# EasyEDA Pro project 低功耗MCU温度测量.epro

# Schematic Schematic1_1
Assembly Variant: Basic; Board Name: Board1; Create Date: 2026-09-13; Page Name: P1; Project Name: 低功耗MCU温度测量; Schematic Name: Schematic1; Update Date: 2026-09-13; Company: 嘉立创EDA; Page Size: A4; Version: V1.0
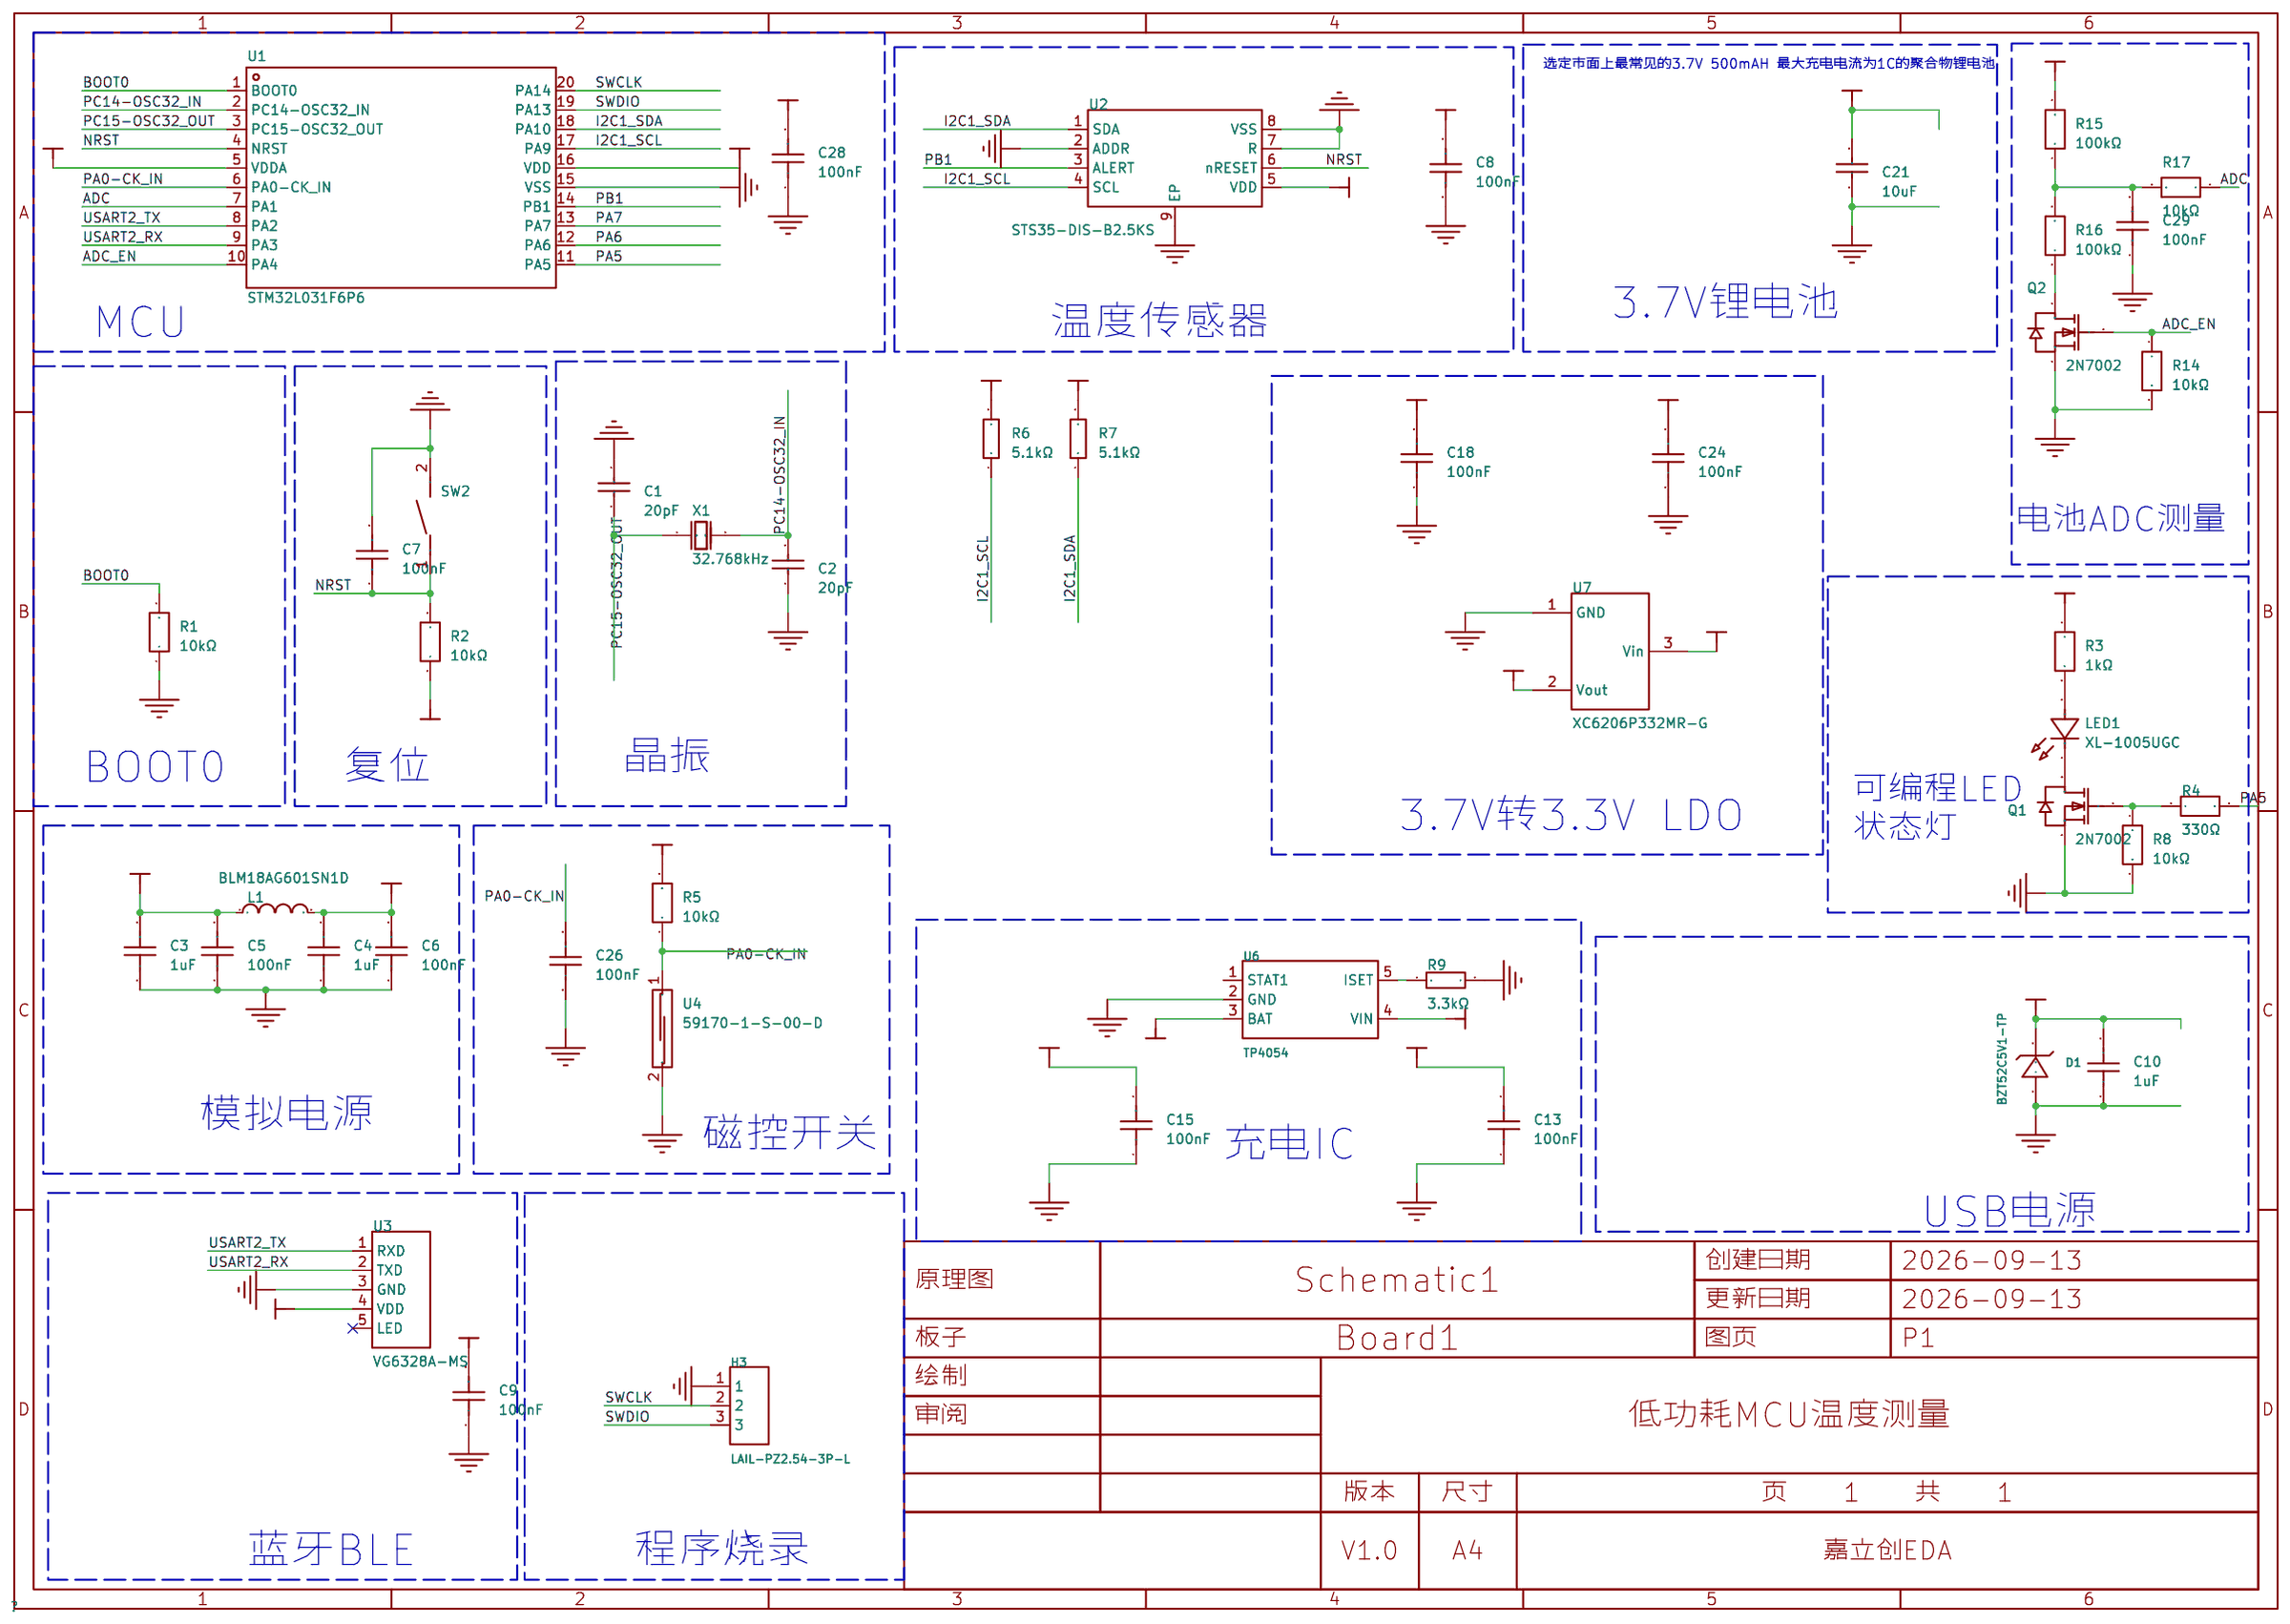
[diagram p0: schematic sheet]

## Parts
C1  20pF  [C0402]
C2  20pF  [C0402]
C3  1uF  [C0402]
C4  1uF  [C0402]
C5  100nF  [C0402]
C6  100nF  [C0402]
C7  100nF  [C0402]
C8  100nF  [C0402]
C9  100nF  [C0402]
C10  1uF  [C0402]
C13  100nF  [C0402]
C15  100nF  [C0402]
C18  100nF  [C0402]
C21  10uF  [C0402]
C24  100nF  [C0402]
C26  100nF  [C0402]
C28  100nF  [C0402]
C29  100nF  [C0402]
D1  BZT52C5V1-TP  [SOD-123_L2.8-W1.6-LS3.7-RD_1]
H3  LAIL-PZ2.54-3P-L  [HDR-TH_3P-P2.54-V-M-1]
L1  BLM18AG601SN1D  [L0603]
LED1  XL-1005UGC  [LED0402-RD_GREEN]
Q1  2N7002  [SOT-23-3_L2.9-W1.3-P1.90-LS2.4-BR]
Q2  2N7002  [SOT-23-3_L2.9-W1.3-P1.90-LS2.4-BR]
R1  10kΩ  [R0402]
R2  10kΩ  [R0402]
R3  1kΩ  [R0402]
R4  330Ω  [R0402]
R5  10kΩ  [R0402]
R6  5.1kΩ  [R0402]
R7  5.1kΩ  [R0402]
R8  10kΩ  [R0402]
R9  3.3kΩ  [R0402]
R14  10kΩ  [R0402]
R15  100kΩ  [R0402]
R16  100kΩ  [R0402]
R17  10kΩ  [R0402]
SW2  TS-1088-AR02016  [SW-SMD_L3.9-W3.0-P4.45]
U1  STM32L031F6P6  [TSSOP-20_L6.5-W4.4-P0.65-LS6.4-BL]
U2  STS35-DIS-B2.5KS  [DFN-8_L2.5-W2.5-P0.50-TL-EP]
U3  VG6328A-MS  [COMM-SMD_5P-L16.0-W13.6-P2.54_I6328A]
U4  59170-1-S-00-D  [SENSOR-SMD_59170-1-S-00-D]
U6  TP4054  [SOT-23-5_L2.9-W1.6-P0.95-LS2.8-BL]
U7  XC6206P332MR-G  [SOT-23-3_L2.9-W1.6-P1.90-LS2.8-BR]
X1  32.768kHz  [CRYSTAL-SMD_2P-L2.0-W1.2]

## Library data of the parts
C1 C2 = CC0402JRNPO9BN200: 容值:20pF;精度:±5%;额定电压:50V;温度系数:NP0;; LCSC Part Name: 20pF ±5% 50V; Supplier Part: C107000; Manufacturer: YAGEO(国巨); Supplier Footprint: 0402; JLCPCB Part Class: Extended Part; Datasheet: https://item.szlcsc.com/datasheet/CC0402JRNPO9BN200/108216.html; Supplier: LCSC; Tolerance: ±5%; Voltage Rating: 50V; Temperature Coefficient: NP0
C3 C4 C10 = HGC0402R5105K500NTEJ: 容值:1uF;精度:±10%;额定电压:50V;温度系数:X5R;; LCSC Part Name: 1uF ±10% 50V; Supplier Part: C7472948; Manufacturer: Chinocera(华瓷); Supplier Footprint: 0402; JLCPCB Part Class: Extended Part; Datasheet: https://item.szlcsc.com/datasheet/HGC0402R5105K500NTEJ/8532795.html; Supplier: LCSC; Tolerance: ±10%; Voltage Rating: 50V; Temperature Coefficient: X5R
C5-C9 C13 C15 C18 C24 C26 C28 C29 = CL05B104KO5NNNC: 容值:100nF;精度:±10%;额定电压:16V;温度系数:X7R;; LCSC Part Name: 100nF ±10% 16V; Supplier Part: C1525; Manufacturer: SAMSUNG(三星); Supplier Footprint: 0402; JLCPCB Part Class: Basic Part; Datasheet: https://item.szlcsc.com/datasheet/CL05B104KO5NNNC/1877.html; Supplier: LCSC; Tolerance: ±10%; Voltage Rating: 16V; Temperature Coefficient: X7R
C21 = CL05A106MQ5NUNC: 容值:10uF;精度:±20%;额定电压:6.3V;温度系数:X5R;; LCSC Part Name: 10uF ±20% 6.3V; Supplier Part: C15525; Manufacturer: SAMSUNG(三星); Supplier Footprint: 0402; JLCPCB Part Class: Basic Part; Datasheet: https://item.szlcsc.com/datasheet/CL05A106MQ5NUNC/16204.html; Supplier: LCSC; Tolerance: ±20%; Voltage Rating: 6.3V; Temperature Coefficient: X5R
D1 = BZT52C5V1-TP: 二极管配置:1个独立式;稳压值(标称值):5.1V;稳压值(范围):4.8V~5.4V;耗散功率(Pd):500mW;; LCSC Part Name: 独立式 耐压:5.1V 电流:2uA@2V; Supplier Part: C78728; Manufacturer: MCC(美微科); Supplier Footprint: SOD-123; JLCPCB Part Class: Extended Part; Datasheet: https://item.szlcsc.com/datasheet/BZT52C5V1-TP/79865.html; Supplier: LCSC; Diode Configuration: 1个独立式; Zener Voltage(Nom): 5.1V; Reverse Leakage Current (Ir): 2uA@2V; Zener Voltage(Range): 4.8V~5.4V; Pd - Power Dissipation: 500mW; Impedance(Zzt): 60Ω; Impedance(Zzk): 480Ω; Operating Junction Temperature Range: -65℃~+150℃
H3 = LAIL-PZ2.54-3P-L: 插针结构:1x3P;间距:2.54mm;圆针/方针:方针;排数:单排;总PIN位数:3P;额定电流:3A;额定电压:250V;塑高:2.5mm;端接针长度:3mm;触头材质:黄铜;触头镀层:金;工作温度:-25℃~+80℃;颜色:黑色;; LCSC Part Name: 1x3P 间距:2.54mm 方针; Supplier Part: C54950604; Manufacturer: LAILAN(莱联); Supplier Footprint: 插件,P=2.54mm; JLCPCB Part Class: Extended Part; Datasheet: https://item.szlcsc.com/datasheet/LAIL-PZ2.54-3P-L/58519957.html; Supplier: LCSC; Pin Structure: 1x3P; Pitch: 2.54mm; Circluar Pins/Square Pins: 方针; Number of Rows: 单排; Number of Pins: 3P; Current Rating: 3A; Voltage Rating (Max): 250V; Insulation Height: 2.5mm; Length of End Connection Pin: 3mm; Contact Material: 黄铜; Contact Plating: 金; Operating Temperature: -25℃~+80℃; Color: 黑色
L1 = BLM18AG601SN1D: 阻抗@频率:600Ω@100MHz;误差:±25%;直流电阻(DCR):380mΩ;; LCSC Part Name: 单路 0603磁珠 阻抗600Ω@100MHz; Supplier Part: C19330; Manufacturer: muRata(村田); Supplier Footprint: 0603; JLCPCB Part Class: Extended Part; Datasheet: https://item.szlcsc.com/datasheet/BLM18AG601SN1D/20038.html; Supplier: LCSC; Impedance @ Frequency: 600Ω@100MHz; Tolerance: ±25%; DC Resistance(DCR): 380mΩ; Current Rating: 500mA; Number of Circuits: 1; Operating Temperature: -55℃~+125℃
LED1 = XL-1005UGC_C965793: 灯头类型:1mmx0.5mm方形灯头;发光颜色:翠绿色;正向压降(Vf):3V;功率:80mW;测试电流:25mA;波长:516nm~531nm;二极管配置:独立二极管;透镜颜色:无色透明透镜;色温:-;发光强度:249mcd;发光角度:120°;载带方式:正贴;工作温度:-40℃~+85℃;; LCSC Part Name: 0402翠绿贴片式发光二极管; Supplier Part: C965793; Manufacturer: XINGLIGHT(成兴光); Supplier Footprint: 0402; JLCPCB Part Class: Extended Part; Datasheet: https://item.szlcsc.com/datasheet/XL-1005UGC/1051402.html; Supplier: LCSC; Lamp Holder Type: 1mmx0.5mm方形灯头; Illumination Color: 翠绿色; Voltage - Forward(Vf): 3V; Power(Watts): 80mW; Test Current: 25mA; Wavelength - Dominant: 516nm~531nm; Peak Wavelength: 531nm; Diode Configuration: 独立二极管; Lens Color: 无色透明透镜; Luminous Intensity: 249mcd; Viewing Angle: 120°; Mounting Style: 正贴; Operating Temperature: -40℃~+85℃
Q1 Q2 = 2N7002_C8545: 数量:1个N沟道;漏源电压(Vdss):60V;连续漏极电流(Id):115mA;导通电阻(RDS(on)):5Ω@10V;耗散功率(Pd):225mW;阈值电压(Vgs(th)):2.5V;; LCSC Part Name: 1个N沟道 耐压:60V 电流:115mA; Supplier Part: C8545; Manufacturer: CJ(江苏长电/长晶); Supplier Footprint: SOT-23; JLCPCB Part Class: Basic Part; Datasheet: https://item.szlcsc.com/datasheet/2N7002/9040.html; Supplier: LCSC; Number: 1个N沟道; Drain to Source Voltage: 60V; Current - Continuous Drain(Id): 115mA; RDS(on): 5Ω@10V; Pd - Power Dissipation: 225mW; Gate Threshold Voltage (Vgs(th)): 2.5V; Input Capacitance(Ciss): 50pF; Reverse Transfer Capacitance (Crss@Vds): 5pF; Type: N沟道; Output Capacitance(Coss): 25pF; Vgs: ±20V
R1 R2 R5 R8 R14 R17 = FRC0402F1002TS: 电阻类型:厚膜电阻;阻值:10kΩ;精度:±1%;功率:62.5mW;工作电压:50V;温度系数:±100ppm/℃;; LCSC Part Name: 10kΩ ±1% 62.5mW 厚膜电阻; Supplier Part: C2906861; Manufacturer: FOJAN(富捷); Supplier Footprint: 0402; JLCPCB Part Class: Extended Part; Datasheet: https://item.szlcsc.com/datasheet/FRC0402F1002TS/3180374.html; Supplier: LCSC; Type: 厚膜电阻; Tolerance: ±1%; Power(Watts): 62.5mW; Voltage-Supply(Max): 50V; Temperature Coefficient: ±100ppm/℃; Operating Temperature: -55℃~+155℃
R3 = FRC0402F1001TS: 电阻类型:厚膜电阻;阻值:1kΩ;精度:±1%;功率:62.5mW;工作电压:50V;温度系数:±100ppm/℃;; LCSC Part Name: 1kΩ ±1% 62.5mW 厚膜电阻; Supplier Part: C2906864; Manufacturer: FOJAN(富捷); Supplier Footprint: 0402; JLCPCB Part Class: Extended Part; Datasheet: https://item.szlcsc.com/datasheet/FRC0402F1001TS/3180377.html; Supplier: LCSC; Type: 厚膜电阻; Tolerance: ±1%; Power(Watts): 62.5mW; Voltage-Supply(Max): 50V; Temperature Coefficient: ±100ppm/℃; Operating Temperature: -55℃~+155℃
R4 = FRC0402J331 TS: 电阻类型:厚膜电阻;阻值:330Ω;精度:±5%;功率:62.5mW;工作电压:50V;温度系数:±100ppm/℃;; LCSC Part Name: 330Ω ±5% 62.5mW 厚膜电阻; Supplier Part: C2906929; Manufacturer: FOJAN(富捷); Supplier Footprint: 0402; JLCPCB Part Class: Extended Part; Datasheet: https://item.szlcsc.com/datasheet/FRC0402J331%2520TS/3180442.html; Supplier: LCSC; Type: 厚膜电阻; Tolerance: ±5%; Power(Watts): 62.5mW; Voltage-Supply(Max): 50V; Temperature Coefficient: ±100ppm/℃; Operating Temperature: -55℃~+155℃
R6 R7 = 0402WGF5101TCE: 电阻类型:厚膜电阻;阻值:5.1kΩ;精度:±1%;功率:62.5mW;工作电压:50V;温度系数:±100ppm/℃;; LCSC Part Name: 厚膜电阻 5.1kΩ ±1%; Supplier Part: C25905; Manufacturer: UNI-ROYAL(厚声); Supplier Footprint: 0402; JLCPCB Part Class: Basic Part; Datasheet: https://item.szlcsc.com/datasheet/0402WGF5101TCE/26648.html; Supplier: LCSC; Type: 厚膜电阻; Tolerance: ±1%; Power(Watts): 62.5mW; Voltage-Supply(Max): 50V; Temperature Coefficient: ±100ppm/℃; Operating Temperature: -55℃~+155℃
R9 = 0402WGF3301TCE: 电阻类型:厚膜电阻;阻值:3.3kΩ;精度:±1%;功率:62.5mW;工作电压:50V;温度系数:±100ppm/℃;; LCSC Part Name: 厚膜电阻 3.3kΩ ±1%; Supplier Part: C25890; Manufacturer: UNI-ROYAL(厚声); Supplier Footprint: 0402; JLCPCB Part Class: Basic Part; Datasheet: https://item.szlcsc.com/datasheet/0402WGF3301TCE/26633.html; Supplier: LCSC; Type: 厚膜电阻; Tolerance: ±1%; Power(Watts): 62.5mW; Voltage-Supply(Max): 50V; Temperature Coefficient: ±100ppm/℃; Operating Temperature: -55℃~+155℃
R15 R16 = RCA02100KJLF: 电阻类型:厚膜电阻;阻值:100kΩ;精度:±5%;功率:62.5mW;工作电压:50V;温度系数:±200ppm/℃;; LCSC Part Name: 100kΩ ±5% 62.5mW; Supplier Part: C22369186; Manufacturer: HKR(香港电阻); Supplier Footprint: 0402; JLCPCB Part Class: Extended Part; Datasheet: https://item.szlcsc.com/datasheet/RCA02100KJLF/23848216.html; Supplier: LCSC; Type: 厚膜电阻; Tolerance: ±5%; Power(Watts): 62.5mW; Voltage-Supply(Max): 50V; Temperature Coefficient: ±200ppm/℃; Operating Temperature: -55℃~+155℃
SW2 = TS-1088-AR02016: 电路结构:单刀单掷;按钮形状:圆形按钮;作用力:1.6N;安装方式:立贴;开关长度:3.9mm;开关宽度:3mm;开关高度:2mm;带支架:不带支架;触点电流:50mA;额定电压:12V;带灯:-;工作寿命:10万次;; LCSC Part Name: 3.9*3*2mm 立贴 轻触开关; Supplier Part: C720477; Manufacturer: XUNPU(讯普); Supplier Footprint: SMD,4x3mm; JLCPCB Part Class: Basic Part; Datasheet: https://item.szlcsc.com/datasheet/TS-1088-AR02016/763484.html; Supplier: LCSC; Circuit: 单刀单掷; Actuator Style: 圆形按钮; Operating Force: 1.6N; Mounting Type: 立贴; Length: 3.9mm; Width: 3mm; Switch Height: 2mm; with Bracket: 不带支架; Contact Current: 50mA; Voltage Rating: 12V; Actuator/Cap Color: 黑色; Termination Style: SMD接片; Life: 10万次; Operating Temperature: -30℃~+80℃
U1 = STM32L031F6P6: CPU内核:ARM Cortex-M0+;CPU最大主频:32MHz;CPU位数:32 Bit;; LCSC Part Name: 超低功耗Arm Cortex-M0+ MCU，具有32-KB Flash存储器和32 MHz CPU; Supplier Part: C115208; Manufacturer: ST(意法半导体); Supplier Footprint: TSSOP-20; JLCPCB Part Class: Extended Part; Datasheet: https://item.szlcsc.com/datasheet/STM32L031F6P6/116454.html; Supplier: LCSC; CPU Core: ARM Cortex-M0+; CPU Maximum Speed: 32MHz; Core Size: 32 Bit; Program Storage Size: 32KB; Program Memory Type: FLASH; RAM Size: 8KB; EEPROM: 1KB; Number of I/O: 15; ADC (Bit): 12bit; Oscillator Type: 内置; Voltage - Supply: 1.8V~3.6V; Operating Temperature: -40℃~+85℃
U2 = STS35-DIS-B2.5KS_C7461886: 检测温度:-;精度:±0.1℃;接口类型:I2C;; LCSC Part Name: 高精度数字温度传感器IC，采用CMOSens技术，具备完全校准和线性化数字输出、I2C接口，适用于多种应用; Supplier Part: C7461886; Manufacturer: Sensirion(瑞士盛思锐); Supplier Footprint: DFN-8(2.5x2.5); JLCPCB Part Class: Extended Part; Datasheet: https://item.szlcsc.com/datasheet/STS35-DIS-B2.5KS/8492078.html; Supplier: LCSC; Tolerance: ±0.1℃; Voltage - Supply: 2.15V~5.5V; Standby Current: 2uA; Interface: I2C; Temperature Conversion Time: 12.5ms; Features: 温度阈值监测；出厂温度校准；片内非易失参数存储；低功耗待机
U3 = VG6328A-MS: 核心芯片:-;接口类型:UART;发射功率:1dBm;通讯距离:20m；60m;接收灵敏度:-92dBm;; LCSC Part Name: AC6328A低功耗主从一体串口透传蓝牙模块; Supplier Part: C48818398; Manufacturer: Vollgo(沃进); Supplier Footprint: SMD,16x13.6mm; JLCPCB Part Class: Extended Part; Datasheet: https://item.szlcsc.com/datasheet/VG6328A-MS/51117022.html; Supplier: LCSC; Interface Type: UART; Wireless Standard: 蓝牙5.3; Output Power(Max): 1dBm; Voltage - Supply: 1.8V~3.6V; Communication Distance: 20m；60m; Sensitivity: -92dBm; Operating Temperature: -40℃~+85℃
U4 = 59170-1-S-00-D: 59170是一款超小型模塑干簧开关，尺寸为11.43mm x 2.29mm x 2.29mm（0.450英寸 x 0.090英寸 x 0.090英寸），引脚有直脚和鸥翼脚两种类型。该开关为常开触点，能够在10W功率下切换高达200Vdc的电压。; LCSC Part Name: 超小型复模簧片开关; Supplier Part: C315909; Manufacturer: Littelfuse(美国力特); Supplier Footprint: SMD; JLCPCB Part Class: Extended Part; Datasheet: https://item.szlcsc.com/datasheet/59170-1-S-00-D/297544.html; Supplier: LCSC
U6 = TP4054_C55349166: 工作电压:-300mV~7.5V;最大充电电流:600mA;电池类型:锂电池;电池节数:1;; Supplier Part: C55349166; Manufacturer: R+O(宏嘉诚); Supplier Footprint: SOT-23-5L; JLCPCB Part Class: Extended Part; Datasheet: https://item.szlcsc.com/datasheet/TP4054/59290393.html; Supplier: LCSC; The Chip Type: 保护芯片; Voltage - Supply: -300mV~7.5V; Charge Current - Max: 600mA; Charging Saturation Voltage: 4.2V; End-Off Voltage: 3V; Type of Battery: 锂电池; Number of Cells: 1; Operating Temperature: -40℃~+85℃
U7 = XC6206P332MR-G_C5446: 输出极性:正极;工作电压:6V;输出电压:3.3V;输出电流:200mA;电源纹波抑制比(PSRR):-;输出类型:固定;; LCSC Part Name: 3.3V 200mA 6V; Supplier Part: C5446; Manufacturer: TOREX(特瑞仕); Supplier Footprint: SOT-23-3L; JLCPCB Part Class: Basic Part; Datasheet: https://item.szlcsc.com/datasheet/XC6206P332MR-G/5896.html; Supplier: LCSC; Output Configuration: 正极; Voltage - Supply: 6V; Output Voltage: 3.3V; Output Current: 200mA; standby current: 1uA; Features: 短路保护；过流保护; Operating Temperature: -40℃~+85℃@(Ta); Output Type: 固定; Number of Outputs: 1
X1 = XKHEL89CGI-112YLC-32.768K: 晶振类型:贴片晶振;频率:32.768kHz;常温频差:±20ppm;负载电容:12.5pF;频率稳定度:-;; LCSC Part Name: YSX2012SK 32.768KHZ 2P 2012 12.5PF ±20PPM -40~85℃; Supplier Part: C7500573; Manufacturer: YXC(扬兴晶振); Supplier Footprint: SMD2012-2P; JLCPCB Part Class: Extended Part; Datasheet: https://item.szlcsc.com/datasheet/XKHEL89CGI-112YLC-32.768K/8579117.html; Supplier: LCSC; Type: 贴片晶振; Normal temperature Frequency Tolerance: ±20ppm; Load Capacitance: 12.5pF; Equivalent Series Resistance(ESR): 100kΩ; Operating Temperature: -40℃~+85℃

## Nets
3.3V: C3.2 C5.2 C8.1 C9.2 C24.2 C28.2 L1.1 R2.1 R3.1 R5.2 R6.2 R7.2 U1.16(VDD) U2.5(VDD) U3.4(VDD) U7.2(Vout)
3.7V: C15.2 C18.2 C21.2 R15.2 U6.3(BAT) U7.3(Vin)
+5V: C10.2 C13.2 D1.1(K) U6.4(VIN)
A3.3V: C4.2 C6.2 L1.2 U1.5(VDDA)
GND: C1.2 C2.1 C3.1 C4.1 C5.1 C6.1 C7.2 C8.2 C9.1 C10.1 C13.1 C15.1 C18.1 C21.1 C24.1 C26.1 C28.1 C29.1 D1.2(A) H3.1 Q1.2(S) Q2.2(S) R1.1 R8.2 R9.1 R14.2 SW2.2 U1.15(VSS) U2.2(ADDR) U2.7(R) U2.8(VSS) U2.9(EP) U3.3(GND) U4.2 U6.2(GND) U7.1(GND)
ADC: R17.1 U1.7(PA1)
ADC_EN: Q2.1(G) R14.1 U1.10(PA4)
BOOT0: R1.2 U1.1(BOOT0)
I2C1_SCL: R6.1 U1.17(PA9) U2.4(SCL)
I2C1_SDA: R7.1 U1.18(PA10) U2.1(SDA)
NRST: C7.1 R2.2 SW2.1 U1.4(NRST) U2.6(nRESET)
PA0-CK_IN: C26.2 R5.1 U1.6(PA0-CK_IN) U4.1
PA5: R4.2 U1.11(PA5)
PA6: U1.12(PA6)
PA7: U1.13(PA7)
PB1: U1.14(PB1) U2.3(ALERT)
PC14-OSC32_IN: C2.2 U1.2(PC14-OSC32_IN) X1.2(OSC2)
PC15-OSC32_OUT: C1.1 U1.3(PC15-OSC32_OUT) X1.1(OSC1)
SWCLK: H3.2 U1.20(PA14)
SWDIO: H3.3 U1.19(PA13)
USART2_RX: U1.9(PA3) U3.2(TXD)
USART2_TX: U1.8(PA2) U3.1(RXD)
$C29_2: C29.2 R15.1 R16.2 R17.2
$LED1_1: LED1.1(K) Q1.3(D)
$LED1_2: LED1.2(A) R3.2
$Q1_1: Q1.1(G) R4.1 R8.1
$Q2_3: Q2.3(D) R16.1
$R9_2: R9.2 U6.5(ISET)

Not connected (* = marked no-connect by the designer): U3 5(LED)*; U6 1(STAT1)

## Notes on the sheet
- 选定市面上最常见的3.7V 500mAH 最大充电电流为1C的聚合物锂电池
- MCU
- 温度传感器
- 3.7V锂电池
- 电池ADC测量
- 晶振
- 可编程LED
  状态灯
- BOOT0
- 复位
- 3.7V转3.3V LDO
- 模拟电源
- 磁控开关
- 充电IC
- USB电源
- 蓝牙BLE
- 程序烧录

# Board PCB
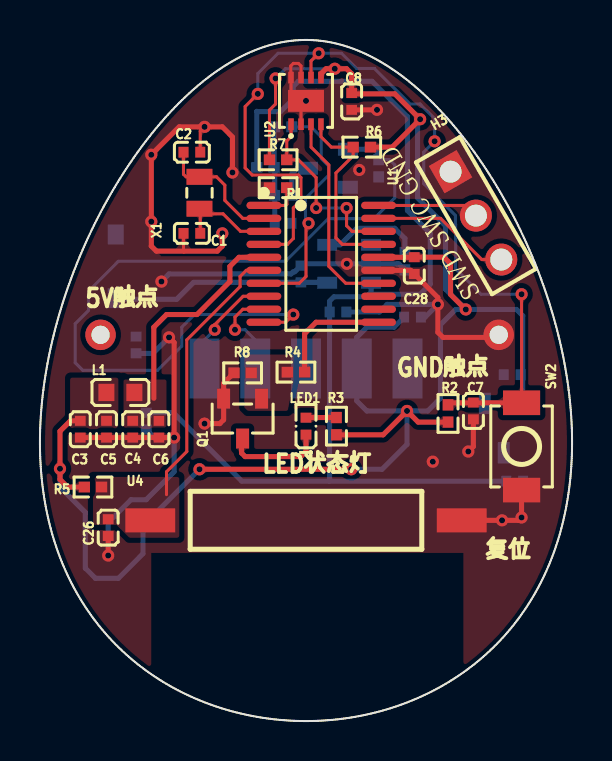
[diagram p1: board, top side]
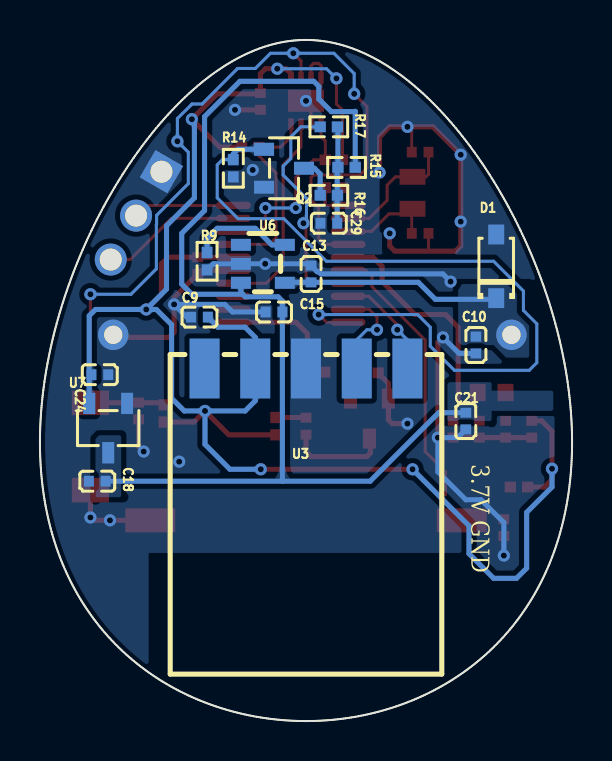
[diagram p2: board, bottom side, seen from below]

Outline 26.65 x 34.1 mm; copper layers: Top Layer, Bottom Layer. Coordinates in mm from the lower left corner of the outline.
Outline path: 0,14.06 0,13.86 0,13.75 0,13.55 0.01,13.45 0.01,13.35 0.01,13.25 0.02,13.15 0.03,12.94 0.03,12.84 0.04,12.74 0.05,12.64 0.05,12.54 0.06,12.44 0.07,12.34 0.08,12.24 0.09,12.14 0.1,12.04 0.11,11.94 0.12,11.84 0.13,11.74 0.15,11.64 0.16,11.54 0.17,11.44 0.19,11.34 0.2,11.24 0.24,11.04 0.25,10.94 0.29,10.75 0.31,10.65 0.33,10.55 0.35,10.45 0.37,10.35 0.39,10.25 0.41,10.16 0.43,10.06 0.46,9.96 0.48,9.87 0.5,9.77 0.53,9.67 0.58,9.48 0.61,9.38 0.67,9.19 0.69,9.1 0.72,9 0.75,8.91 0.78,8.81 0.82,8.72 0.85,8.62 0.88,8.53 0.92,8.44 0.95,8.34 0.98,8.25 1.02,8.16 1.06,8.07 1.09,7.97 1.13,7.88 1.17,7.79 1.21,7.7 1.25,7.61 1.29,7.52 1.33,7.43 1.37,7.34 1.41,7.25 1.45,7.16 1.5,7.07 1.54,6.98 1.59,6.89 1.63,6.81 1.68,6.72 1.72,6.63 1.77,6.55 1.82,6.46 1.87,6.37 1.92,6.29 1.97,6.2 2.02,6.12 2.07,6.03 2.12,5.95 2.17,5.87 2.23,5.79 2.28,5.7 2.34,5.62 2.39,5.54 2.45,5.46 2.5,5.38 2.56,5.3 2.62,5.22 2.68,5.14 2.74,5.06 2.79,4.98 2.85,4.9 2.92,4.83 2.98,4.75 3.04,4.67 3.1,4.6 3.23,4.45 3.29,4.37 3.36,4.3 3.42,4.23 3.49,4.15 3.56,4.08 3.62,4.01 3.69,3.94 3.76,3.87 3.83,3.8 3.9,3.73 3.97,3.66 4.04,3.59 4.11,3.53 4.18,3.46 4.25,3.39 4.33,3.33 4.4,3.26 4.48,3.2 4.55,3.13 4.62,3.07 4.7,3.01 4.78,2.94 4.85,2.88 4.93,2.82 5.01,2.76 5.09,2.7 5.16,2.64 5.24,2.58 5.32,2.52 5.4,2.47 5.48,2.41 5.56,2.35 5.65,2.3 5.73,2.24 5.81,2.19 5.89,2.13 5.97,2.08 6.06,2.03 6.14,1.98 6.31,1.87 6.48,1.78 6.57,1.73 6.65,1.68 6.74,1.63 6.83,1.58 6.91,1.54 7,1.49 7.09,1.45 7.18,1.41 7.27,1.36 7.36,1.32 7.45,1.28 7.54,1.24 7.63,1.2 7.72,1.16 7.81,1.12 7.9,1.08 7.99,1.04 8.08,1 8.17,0.97 8.27,0.93 8.36,0.89 8.45,0.86 8.55,0.83 8.64,0.79 8.73,0.76 8.83,0.73 8.92,0.7 9.01,0.67 9.11,0.64 9.2,0.61 9.3,0.58 9.39,0.55 9.49,0.52 9.59,0.5 9.68,0.47 9.78,0.45 9.87,0.42 9.97,0.4 10.07,0.38 10.16,0.35 10.26,0.33 10.36,0.31 10.46,0.29 10.55,0.27 10.65,0.25 10.85,0.22 11.04,0.18 11.14,0.17 11.24,0.15 11.34,0.14 11.44,0.12 11.53,0.11 11.63,0.1 11.73,0.09 11.83,0.08 11.93,0.07 12.03,0.06 12.13,0.05 12.23,0.04 12.33,0.03 12.43,0.03 12.53,0.02 12.63,0.02 12.73,0.01 12.83,0.01 12.92,0.01 13.02,0 13.12,0 13.22,0 13.32,0 13.42,0 13.52,0 13.62,0 13.72,0.01 13.82,0.01 13.92,0.01 14.02,0.02 14.12,0.02 14.22,0.03 14.32,0.03 14.42,0.04 14.52,0.05 14.62,0.06 14.72,0.07 14.81,0.08 14.91,0.09 15.01,0.1 15.11,0.11 15.21,0.12 15.31,0.14 15.41,0.15 15.51,0.17 15.6,0.18 15.8,0.22 16,0.25 16.09,0.27 16.19,0.29 16.29,0.31 16.39,0.33 16.48,0.35 16.58,0.38 16.68,0.4 16.77,0.42 16.87,0.45 16.96,0.47 17.06,0.5 17.16,0.52 17.25,0.55 17.35,0.58 17.44,0.61 17.54,0.64 17.63,0.67 17.73,0.7 17.82,0.73 17.91,0.76 18.01,0.79 18.1,0.83 18.19,0.86 18.29,0.89 18.38,0.93 18.47,0.97 18.56,1 18.66,1.04 18.75,1.08 18.84,1.12 18.93,1.16 19.02,1.2 19.11,1.24 19.2,1.28 19.29,1.32 19.38,1.36 19.47,1.41 19.56,1.45 19.64,1.49 19.73,1.54 19.82,1.58 19.91,1.63 19.99,1.68 20.08,1.73 20.16,1.78 20.34,1.87 20.5,1.98 20.59,2.03 20.67,2.08 20.75,2.13 20.84,2.19 20.92,2.24 21,2.3 21.08,2.35 21.16,2.41 21.24,2.47 21.32,2.52 21.4,2.58 21.48,2.64 21.56,2.7 21.64,2.76 21.72,2.82 21.79,2.88 21.87,2.94 21.95,3.01 22.02,3.07 22.1,3.13 22.17,3.2 22.24,3.26 22.32,3.33 22.39,3.39 22.46,3.46 22.53,3.53 22.61,3.59 22.68,3.66 22.75,3.73 22.82,3.8 22.89,3.87 22.95,3.94 23.02,4.01 23.09,4.08 23.16,4.15 23.22,4.23 23.29,4.3 23.35,4.37 23.42,4.45 23.55,4.6 23.61,4.67 23.67,4.75 23.73,4.83 23.79,4.9 23.85,4.98 23.91,5.06 23.97,5.14 24.03,5.22 24.09,5.3 24.14,5.38 24.2,5.46 24.25,5.54 24.31,5.62 24.36,5.7 24.42,5.79 24.47,5.87 24.52,5.95 24.58,6.03 24.63,6.12 24.68,6.2 24.73,6.29 24.78,6.37 24.83,6.46 24.87,6.55 24.92,6.63 24.97,6.72 25.01,6.81 25.06,6.89 25.11,6.98 25.15,7.07 25.19,7.16 25.24,7.25 25.28,7.34 25.32,7.43 25.36,7.52 25.4,7.61 25.44,7.7 25.48,7.79 25.52,7.88 25.55,7.97 25.59,8.07 25.63,8.16 25.66,8.25 25.7,8.34 25.73,8.44 25.76,8.53 25.8,8.62 25.83,8.72 25.86,8.81 25.89,8.91 25.92,9 25.95,9.1 25.98,9.19 26.04,9.38 26.06,9.48 26.12,9.67 26.14,9.77 26.17,9.87 26.19,9.96 26.21,10.06 26.24,10.16 26.26,10.25 26.28,10.35 26.3,10.45 26.32,10.55 26.34,10.65 26.36,10.75 26.39,10.94 26.41,11.04 26.44,11.24 26.46,11.34 26.47,11.44 26.49,11.54 26.5,11.64 26.51,11.74 26.52,11.84 26.54,11.94 26.55,12.04 26.56,12.14 26.57,12.24 26.58,12.34 26.58,12.44 26.59,12.54 26.6,12.64 26.61,12.74 26.61,12.84 26.62,12.94 26.63,13.15 26.63,13.25 26.64,13.35 26.64,13.45 26.64,13.55 26.65,13.75 26.65,13.86 26.65,14.06 26.65,14.16 26.64,14.36 26.64,14.47 26.64,14.57 26.63,14.67 26.63,14.77 26.62,14.87 26.62,14.97 26.61,15.08 26.61,15.18 26.6,15.28 26.59,15.38 26.59,15.48 26.58,15.59 26.57,15.69 26.56,15.79 26.55,15.89 26.54,15.99 26.53,16.09 26.51,16.3 26.5,16.4 26.47,16.6 26.45,16.81 26.42,17.01 26.4,17.11 26.39,17.21 26.37,17.31 26.35,17.41 26.34,17.52 26.3,17.72 26.26,17.92 26.25,18.02 26.21,18.22 26.19,18.32 26.16,18.42 26.14,18.53 26.12,18.63 26.1,18.73 26.08,18.83 26.05,18.93 26.03,19.03 26.01,19.13 25.96,19.33 25.93,19.43 25.91,19.53 25.88,19.63 25.86,19.73 25.8,19.93 25.75,20.13 25.72,20.23 25.69,20.32 25.66,20.42 25.63,20.52 25.6,20.62 25.57,20.72 25.54,20.82 25.51,20.92 25.48,21.02 25.45,21.11 25.41,21.21 25.38,21.31 25.35,21.41 25.32,21.51 25.28,21.6 25.25,21.7 25.21,21.8 25.18,21.9 25.14,21.99 25.11,22.09 25.07,22.19 25.04,22.28 25,22.38 24.96,22.48 24.89,22.67 24.85,22.77 24.81,22.86 24.77,22.96 24.73,23.06 24.7,23.15 24.66,23.25 24.62,23.34 24.58,23.44 24.49,23.63 24.45,23.72 24.41,23.82 24.37,23.91 24.32,24.01 24.28,24.1 24.24,24.19 24.2,24.29 24.15,24.38 24.06,24.57 24.02,24.66 23.93,24.85 23.88,24.94 23.79,25.12 23.74,25.22 23.69,25.31 23.65,25.4 23.6,25.49 23.55,25.58 23.45,25.77 23.4,25.86 23.35,25.95 23.3,26.04 23.25,26.13 23.2,26.22 23.15,26.31 23.1,26.4 23.05,26.48 22.99,26.57 22.89,26.75 22.84,26.84 22.73,27.02 22.67,27.1 22.62,27.19 22.51,27.37 22.45,27.45 22.4,27.54 22.34,27.62 22.28,27.71 22.23,27.8 22.17,27.88 22.11,27.97 22.06,28.05 21.94,28.22 21.88,28.3 21.76,28.47 21.7,28.56 21.64,28.64 21.58,28.72 21.52,28.8 21.46,28.88 21.33,29.05 21.27,29.13 21.14,29.29 21.08,29.37 21.02,29.45 20.95,29.53 20.89,29.61 20.82,29.69 20.69,29.84 20.63,29.92 20.56,30 20.49,30.07 20.43,30.15 20.36,30.22 20.22,30.38 20.15,30.45 20.08,30.52 20.02,30.6 19.95,30.67 19.88,30.74 19.81,30.82 19.73,30.89 19.66,30.96 19.59,31.03 19.52,31.1 19.38,31.24 19.3,31.31 19.16,31.44 19.08,31.51 19.01,31.58 18.93,31.64 18.86,31.71 18.78,31.77 18.71,31.84 18.63,31.9 18.55,31.96 18.47,32.03 18.4,32.09 18.32,32.15 18.24,32.21 18.16,32.27 18.09,32.33 18.01,32.39 17.93,32.44 17.85,32.5 17.77,32.56 17.69,32.61 17.6,32.67 17.52,32.72 17.44,32.77 17.36,32.82 17.28,32.88 17.2,32.93 17.11,32.98 17.03,33.02 16.95,33.07 16.86,33.12 16.78,33.16 16.69,33.21 16.61,33.25 16.52,33.3 16.44,33.34 16.35,33.38 16.27,33.42 16.18,33.46 16.09,33.5 16.01,33.53 15.92,33.57 15.83,33.6 15.74,33.64 15.66,33.67 15.57,33.7 15.48,33.73 15.39,33.76 15.3,33.79 15.22,33.82 15.13,33.84 15.04,33.87 14.95,33.89 14.86,33.91 14.77,33.94 14.68,33.95 14.59,33.97 14.5,33.99 14.41,34.01 14.32,34.02 14.23,34.03 14.14,34.05 14.05,34.06 13.96,34.07 13.87,34.08 13.78,34.08 13.69,34.09 13.59,34.09 13.5,34.1 13.41,34.1 13.32,34.1 13.23,34.1 13.14,34.1 13.05,34.09 12.96,34.09 12.87,34.08 12.78,34.08 12.69,34.07 12.6,34.06 12.51,34.05 12.42,34.03 12.33,34.02 12.24,34.01 12.15,33.99 12.06,33.97 11.97,33.95 11.88,33.94 11.79,33.91 11.7,33.89 11.61,33.87 11.52,33.84 11.43,33.82 11.34,33.79 11.25,33.76 11.17,33.73 11.08,33.7 10.99,33.67 10.9,33.64 10.81,33.6 10.73,33.57 10.64,33.53 10.55,33.5 10.47,33.46 10.38,33.42 10.3,33.38 10.21,33.34 10.12,33.3 10.04,33.25 9.95,33.21 9.87,33.16 9.78,33.12 9.7,33.07 9.62,33.02 9.53,32.98 9.45,32.93 9.37,32.88 9.29,32.82 9.2,32.77 9.12,32.72 9.04,32.67 8.96,32.61 8.88,32.56 8.8,32.5 8.72,32.44 8.64,32.39 8.56,32.33 8.48,32.27 8.4,32.21 8.33,32.15 8.25,32.09 8.17,32.03 8.09,31.96 8.02,31.9 7.94,31.84 7.87,31.77 7.79,31.71 7.71,31.64 7.64,31.58 7.56,31.51 7.49,31.44 7.34,31.31 7.27,31.24 7.13,31.1 7.05,31.03 6.98,30.96 6.91,30.89 6.84,30.82 6.77,30.74 6.7,30.67 6.63,30.6 6.56,30.52 6.49,30.45 6.42,30.38 6.29,30.22 6.22,30.15 6.15,30.07 6.09,30 6.02,29.92 5.95,29.84 5.82,29.69 5.76,29.61 5.69,29.53 5.63,29.45 5.57,29.37 5.5,29.29 5.38,29.13 5.31,29.05 5.19,28.88 5.13,28.8 5.07,28.72 5.01,28.64 4.95,28.56 4.89,28.47 4.77,28.3 4.71,28.22 4.59,28.05 4.53,27.97 4.48,27.88 4.42,27.8 4.36,27.71 4.3,27.62 4.25,27.54 4.19,27.45 4.14,27.37 4.03,27.19 3.97,27.1 3.92,27.02 3.81,26.84 3.76,26.75 3.65,26.57 3.6,26.48 3.55,26.4 3.5,26.31 3.45,26.22 3.4,26.13 3.34,26.04 3.29,25.95 3.25,25.86 3.2,25.77 3.1,25.58 3.05,25.49 3,25.4 2.95,25.31 2.91,25.22 2.86,25.12 2.77,24.94 2.72,24.85 2.63,24.66 2.58,24.57 2.5,24.38 2.45,24.29 2.41,24.19 2.36,24.1 2.32,24.01 2.28,23.91 2.24,23.82 2.19,23.72 2.15,23.63 2.07,23.44 2.03,23.34 1.99,23.25 1.95,23.15 1.91,23.06 1.87,22.96 1.83,22.86 1.8,22.77 1.76,22.67 1.68,22.48 1.65,22.38 1.61,22.28 1.57,22.19 1.54,22.09 1.5,21.99 1.47,21.9 1.43,21.8 1.4,21.7 1.36,21.6 1.33,21.51 1.3,21.41 1.26,21.31 1.23,21.21 1.2,21.11 1.17,21.02 1.14,20.92 1.11,20.82 1.08,20.72 1.05,20.62 1.02,20.52 0.99,20.42 0.96,20.32 0.93,20.23 0.9,20.13 0.84,19.93 0.79,19.73 0.76,19.63 0.74,19.53 0.71,19.43 0.69,19.33 0.64,19.13 0.62,19.03 0.59,18.93 0.57,18.83 0.55,18.73 0.52,18.63 0.5,18.53 0.48,18.42 0.46,18.32 0.44,18.22 0.4,18.02 0.38,17.92 0.34,17.72 0.31,17.52 0.29,17.41 0.28,17.31 0.26,17.21 0.24,17.11 0.23,17.01 0.2,16.81 0.17,16.6 0.15,16.4 0.14,16.3 0.11,16.09 0.1,15.99 0.09,15.89 0.08,15.79 0.08,15.69 0.07,15.59 0.06,15.48 0.05,15.38 0.04,15.28 0.04,15.18 0.03,15.08 0.03,14.97 0.02,14.87 0.02,14.77 0.01,14.67 0.01,14.57 0.01,14.47 0,14.36 0,14.16 0,14.06
Stack: Top Layer 0.035mm / Dielectric1 1.51mm FR4 er 4.5 / Bottom Layer 0.035mm

## Design rules (mm)
spacing copperThickness1oz (default): track to track 0.102, other pairs 0.152 to 0.3
spacing copperThickness2oz: track to track 0.203, other pairs 0.152 to 0.3
track width copperThickness1oz (default): min 0.127, default 0.152, max 2.54
track width PWR: min 0.127, default 0.254, max 2.54
differential pair differentialPair (default): width min 0.127, default 0.254, max 2.54; gap min 0.152, default 0.152
net 3.7V uses copperRegion
net GND uses copperRegion
net 3.3V uses copperRegion
net A3.3V uses copperRegion
net $Q1_1 uses copperRegion
net PA0-CK_IN uses copperRegion

## Placement (name value [footprint] x y rotation side)
C1  20pF  [C0402]  7.61 24.42 180 top
C2  20pF  [C0402]  7.61 28.48 180 top
C3  1uF  [C0402]  2.02 14.61 90 top
C4  1uF  [C0402]  4.64 14.61 90 top
C5  100nF  [C0402]  3.33 14.61 90 top
C6  100nF  [C0402]  5.96 14.61 90 top
C7  100nF  [C0402]  21.71 15.53 270 top
C8  100nF  [C0402]  15.61 31.02 270 top
C9  100nF  [C0402]  18.66 20.22 180 bottom
C10  1uF  [C0402]  4.81 18.83 90 bottom
C13  100nF  [C0402]  13.07 22.38 270 bottom
C15  100nF  [C0402]  14.93 20.48 180 bottom
C18  100nF  [C0402]  23.78 12.01 180 bottom
C21  10uF  [C0402]  5.32 15.02 90 bottom
C24  100nF  [C0402]  23.65 17.34 0 bottom
C26  100nF  [C0402]  3.42 9.68 90 top
C28  100nF  [C0402]  18.75 22.8 90 top
C29  100nF  [C0402]  12.18 24.92 180 bottom
D1  BZT52C5V1-TP  [SOD-123_L2.8-W1.6-LS3.7-RD_1]  3.8 22.77 90 bottom
H3  LAIL-PZ2.54-3P-L  [HDR-TH_3P-P2.54-V-M-1]  21.83 25.3 300 top
L1  BLM18AG601SN1D  [L0603]  4.03 16.45 0 top
LED1  XL-1005UGC  [LED0402-RD_GREEN]  13.32 14.76 90 top
NOREF  -  [Pad_e162]  3.04 19.34 0 top
NOREF#2  -  [Pad_e163]  22.97 19.34 0 top
Q1  2N7002  [SOT-23-3_L2.9-W1.3-P1.90-LS2.4-BR]  10.15 15.14 90 top
Q2  2N7002  [SOT-23-3_L2.9-W1.3-P1.90-LS2.4-BR]  14.42 27.68 0 bottom
R1  10kΩ  [R0402]  11.93 26.7 0 top
R2  10kΩ  [R0402]  20.44 15.4 90 top
R3  1kΩ  [R0402]  14.85 14.76 90 top
R4  330Ω  [R0402]  12.82 17.47 0 top
R5  10kΩ  [R0402]  2.66 11.72 180 top
R6  5.1kΩ  [R0402]  16.12 28.73 0 top
R7  5.1kΩ  [R0402]  11.93 28.1 180 top
R8  10kΩ  [R0402]  10.15 17.43 180 top
R9  3.3kΩ  [R0402]  18.28 23.02 90 bottom
R14  10kΩ  [R0402]  16.96 27.68 270 bottom
R15  100kΩ  [R0402]  11.29 27.72 180 bottom
R16  100kΩ  [R0402]  12.18 26.32 180 bottom
R17  10kΩ  [R0402]  12.18 29.75 180 bottom
SW2  TS-1088-AR02016  [SW-SMD_L3.9-W3.0-P4.45]  24.12 13.75 270 top
U1  STM32L031F6P6  [TSSOP-20_L6.5-W4.4-P0.65-LS6.4-BL]  14.09 22.89 270 top
U2  STS35-DIS-B2.5KS  [DFN-8_L2.5-W2.5-P0.50-TL-EP]  13.32 31.05 90 top
U3  VG6328A-MS  [COMM-SMD_5P-L16.0-W13.6-P2.54_I6328A]  13.32 17.65 0 bottom
U4  59170-1-S-00-D  [SENSOR-SMD_59170-1-S-00-D]  13.32 10.05 0 top
U6  TP4054  [SOT-23-5_L2.9-W1.6-P0.95-LS2.8-BL]  15.48 22.89 270 bottom
U7  XC6206P332MR-G  [SOT-23-3_L2.9-W1.6-P1.90-LS2.8-BR]  23.23 14.67 90 bottom
X1  32.768kHz  [CRYSTAL-SMD_2P-L2.0-W1.2]  7.99 26.45 90 top

## Footprints (pads in the part's own frame, mm; a bottom-side part is the same pattern mirrored in y, then rotated)
C0402
  rect 0.5x0.54 smd: 1(-0.42,0) 2(0.42,0)
COMM-SMD_5P-L16.0-W13.6-P2.54_I6328A
  rect 1.5x3 smd: 1(-5.08,0) 2(-2.54,0) 3(0,0) 4(2.54,0) 5(5.08,0)
CRYSTAL-SMD_2P-L2.0-W1.2
  rect 0.8x1.3 smd: 1(-0.8,0) 2(0.8,0)
DFN-8_L2.5-W2.5-P0.50-TL-EP
  rect 0.585x0.28 smd: 1(-1.167,0.75) 2(-1.167,0.25) 3(-1.167,-0.25) 4(-1.167,-0.75) 5(1.167,-0.75) 6(1.167,-0.25) 7(1.167,0.25) 8(1.167,0.75)
  rect 1.1x1.8 smd: 9(0,0)
HDR-TH_3P-P2.54-V-M-1
  rect 1.575x1.6 hole 1.1: 1(-2.54,0)
  round 1.6 hole 1.1: 2(0,0) 3(2.54,0)
L0603
  rect 0.8x0.864 smd: 1(-0.7,0) 2(0.7,0)
LED0402-RD_GREEN
  rect 0.5x0.54 smd: 1(-0.425,0) 2(0.425,0)
Pad_e162
  round 1.524 hole 0.914: 1(0,0)
Pad_e163
  round 1.524 hole 0.914: 2(0,0)
R0402
  rect 0.566x0.54 smd: 1(-0.433,0) 2(0.433,0)
SENSOR-SMD_59170-1-S-00-D
  rect 2.5x1.2 smd: 1(-7.8,0) 2(7.8,0)
SOD-123_L2.8-W1.6-LS3.7-RD_1
  rect 1x0.8 smd: 1(-1.593,0) 2(1.593,0)
SOT-23-3_L2.9-W1.3-P1.90-LS2.4-BR
  rect 1x0.65 smd: 1(1,-0.95) 2(1,0.95) 3(-1,0)
SOT-23-3_L2.9-W1.6-P1.90-LS2.8-BR
  rect 1.07x0.6 smd: 1(1.235,-0.95) 2(1.235,0.95) 3(-1.235,0)
SOT-23-5_L2.9-W1.6-P0.95-LS2.8-BL
  rect 0.6x1 smd: 1(-0.95,-1.1) 2(0,-1.1) 3(0.95,-1.1) 4(0.95,1.1) 5(-0.95,1.1)
SW-SMD_L3.9-W3.0-P4.45
  rect 1.23x1.86 smd: 1(-2.185,0) 2(2.185,0)
TSSOP-20_L6.5-W4.4-P0.65-LS6.4-BL
  oval 0.364x1.742 smd: 1(-2.925,-2.871) 2(-2.275,-2.871) 3(-1.625,-2.871) 4(-0.975,-2.871) 5(-0.325,-2.871) 6(0.325,-2.871) 7(0.975,-2.871) 8(1.625,-2.871) 9(2.275,-2.871) 10(2.925,-2.871) 11(2.925,2.871) 12(2.275,2.871) 13(1.625,2.871) 14(0.975,2.871) 15(0.325,2.871) 16(-0.325,2.871) 17(-0.975,2.871) 18(-1.625,2.871) 19(-2.275,2.871) 20(-2.925,2.871)

## Nets
As in the schematic, except:
+5V: C10.2 C13.2 D1.1 NOREF.1 U6.4
GND: C1.2 C2.1 C3.1 C4.1 C5.1 C6.1 C7.2 C8.2 C9.1 C10.1 C13.1 C15.1 C18.1 C21.1 C24.1 C26.1 C28.1 C29.1 D1.2 H3.1 NOREF#2.2 Q1.2 Q2.2 R1.1 R8.2 R9.1 R14.2 SW2.2 U1.15 U2.2 U2.7 U2.8 U2.9 U3.3 U4.2 U6.2 U7.1

Pads without a net: U3 5; U6 1

## Via types
v1: diameter 0.61, hole 0.305, Top Layer to Bottom Layer, 37 vias

## Routing (per net, layer and track width the routed paths; a pad name or vN(x,y) marks a point on that pad's centre or on a via; arc(x,y) is an arc through that point)
3.3V: length 95.8
  Top Layer w0.152: R7.2 11.49,30.59 11.8,30.89 v1(11.8,32.17)
  Top Layer w0.254: R5.2 1.39,11.72 1,12.1 v1(1,12.63) 1,14.51 1.53,15.03 C3.2 ; R3.1 17.19,14.33 v1(18.38,15.53) 18.94,14.97 R2.1 ; U1.16 18.74,23.22 C28.2 20.23,23.22 20.56,22.89 20.56,21.36 21.31,20.61 v1(21.32,20.61) ; R6.2 17.64,28.73 v1(19.04,30.13) 17.77,31.4 15.65,31.4 C8.1 15.61,32.41 15.36,32.66 v1(14.76,32.66) 14.33,32.66 14.07,32.41 U2.5 ; v1(15.59,12.61) 8.12,12.61
  Bottom Layer w0.152: 11.8,32.16 12.3,32.66 v1(14.76,32.66)
  Bottom Layer w0.254: v1(18.38,15.53) 19.42,15.53 20.05,16.16 20.05,19.84 20.82,20.61 v1(21.32,20.61) ; v1(18.38,15.53) 18.38,13.85 17.13,12.61 v1(15.59,12.61) ; v1(18.38,15.53) 16.37,15.53 15.86,16.03 U3.4 15.86,19.21 16.37,19.72 17.73,19.72 C9.2 ; v1(21.32,20.61) 20.31,21.62 20.31,24.8 18.91,26.19 18.91,30 v1(19.04,30.13) ; v1(21.32,20.61) 23.86,20.61 24.18,20.29 U7.2 ; v1(1,12.63) 1,11.72 2.27,10.45 2.27,7.65 2.78,7.14 3.93,7.14 5.16,8.38 5.16,9.78 v1(7.99,12.61)
3.7V: length 55.4
  Bottom Layer w0.254: U6.3 16.58,21.45 16.5,21.37 ; 16.5,21.37 19.04,21.37 19.55,21.88 19.55,24.42 18.4,25.56 18.4,30.26 16.63,32.03 12.94,32.03 12.68,31.77 12.68,31.14 12.05,30.51 10.87,30.51 10.86,30.53 R15.2 ; 16.5,21.37 16.37,21.24 14.72,21.24 14.5,21.03 C15.2 14.5,12.03 14.49,12.01 ; 14.49,12.01 10.11,12.01 6.68,15.44 C21.2 ; 14.49,12.01 C18.2
+5V: length 11
  Bottom Layer w0.254: D1.1 3.86,21.11 6.85,21.11 7.7,21.96 C13.2 14.36,21.96 U6.4
A3.3V: length 11
  Top Layer w0.254: U1.5 9.97,23.22 9.51,22.77 9.51,22 7.86,20.35 6.34,20.35 5.7,19.72 5.7,16.16
GND: length 82.3
  Top Layer w0.152: U2.2 13.07,30.8 v1(13.32,31.05) ; C2.1 8.03,29.53 v1(8.24,29.75) ; C1.2 7.19,23.54 7.2,23.53 ; U2.7 13.07,32.79 12.94,32.92 12.69,32.92 12.56,32.8 12.56,32.23 U2.8 12.57,30.91
  Top Layer w0.254: v1(6.47,19.21) 6.72,18.95 v1(6.72,14.19) C6.1 C4.1 C5.1 C3.1 ; NOREF#2.2 22.85,19.21 20.18,19.21 19.93,19.46 v1(19.93,20.86) 19.93,21.2 C28.1 18.56,22.57 U1.15 ; C7.2 21.71,13.75 v1(21.45,13.49) ; C26.1 v1(3.42,8.29) ; v1(9.64,27.46) 9.64,29.24 9.13,29.75 v1(8.24,29.75) 6.97,29.75 v1(5.58,28.35) v1(5.58,25) 5.58,23.78 5.83,23.53 8.88,23.53 9.13,23.78 v1(9.13,24.42) ; R8.2 9.2,16.91 Q1.2 9.2,15.08 9,14.89 v1(8.24,14.89) ; U4.2 v1(23.14,10.05) 23.98,10.05 v1(24.12,10.19) SW2.2 ; C8.2 v1(16.88,30.6)
  Bottom Layer w0.254: C9.1 19.29,20.22 v1(19.93,20.86) 17.39,20.86 17.01,20.48 C15.1 ; R9.1 17.97,22.89 17.89,22.89 17.89,22.89 U6.2 v1(15.37,22.89) 13.16,22.89 C13.1 12.76,22.49 12.68,22.49 12.57,22.38 6.47,22.38 v1(6.08,22) ; v1(3.42,8.29) 3.42,9.94 4.56,11.08 5.32,11.08 6.72,12.48 v1(6.72,14.19) 5.73,14.19 C21.1 ; v1(6.47,19.21) 5.66,18.41 C10.1
  vias: v1(15.99,27.59) v1(19.67,12.99)
$C29_2: length 4.8
  Bottom Layer w0.254: C29.2 11.76,27.68 R15.1 11.72,29.6 11.83,29.71
$LED1_1: length 5
  Top Layer w0.254: LED1.1 13.32,13.49 13.07,13.24 10.28,13.24 10.1,13.42 10.1,14.09 Q1.3
$LED1_2: length 1.5
  Top Layer w0.254: LED1.2 13.33,15.2 R3.2
$Q2_3: length 2
  Bottom Layer w0.254: R16.1 12.61,27.39 12.9,27.68 Q2.3
$R9_2: length 5.2
  Bottom Layer w0.254: R9.2 18.28,24.16 17.77,24.67 15.86,24.67 15.03,23.84 U6.5
ADC: length 11.7
  Top Layer w0.152: v1(13.45,24.92) 13.32,24.8 13.32,22.26 12.98,21.92 U1.7
  Bottom Layer w0.152: R17.1 13.58,29.75 14.09,29.24 14.09,28.16 14.47,27.78 14.47,27.34 13.3,26.17 13.3,25.08 v1(13.45,24.92)
ADC_EN: length 39.9
  Top Layer w0.152: U1.10 12.3,19.97 v1(12.69,20.35)
  Bottom Layer w0.152: 12.56,20.35 7.74,20.35 7.1,19.72 7.1,18.77 5.89,17.56 2.15,17.56 1.77,17.94 1.77,19.89 2.44,20.56 2.44,21.53 3.93,23.02 12.3,23.02 14.43,25.15 16.73,25.15 17.77,26.19 17.77,27.84 17.5,28.11 R14.1
  Bottom Layer w0.254: R14.1 16.96,28.4 16.73,28.63 Q2.1
BOOT0: length 2.2
  Top Layer w0.152: U1.1 11.22,25.81 12.31,25.81 12.36,25.87 12.36,26.89
I2C1_SCL: length 9.6
  Top Layer w0.152: U1.17 15.14,23.87 14.82,24.19 14.82,27.44 15.68,28.3 15.68,28.73 14.59,28.73 14.07,29.25 U2.4
I2C1_SDA: length 9.4
  Top Layer w0.152: v1(13.83,25.69) 13.83,27.21 12.94,28.1 R7.1 12.36,29.04 12.57,29.25 U2.1 ; U1.18 15.64,24.52 15.36,24.8 v1(15.36,25.69)
  Bottom Layer w0.152: v1(13.83,25.69) v1(15.36,25.69)
NRST: length 46.3
  Top Layer w0.152: v1(10.91,31.4) 10.28,30.77 10.28,27.69 10.63,27.34 12.94,27.34 13.07,27.21 13.07,26.07 12.69,25.69 12.69,24.16 12.39,23.87 U1.4 ; SW2.1 v1(24.12,21.37) ; v1(13.96,33.43) 13.57,33.05 U2.6
  Top Layer w0.254: R2.2 20.54,15.93 SW2.1
  Bottom Layer w0.152: 16.75,32.66 16.75,32.67 16.74,32.67 ; 16.75,32.66 18.53,30.89 19.03,30.89 ; 16.75,32.66 16.74,32.67 ; v1(24.12,21.37) 22.09,21.37 20.82,22.64 20.82,24.87 20.8,24.88 20.8,25.32 19.22,26.91 19.22,28.48 v1(19.76,29.03) 19.76,30.16 19.07,30.84 ; 19.07,30.84 19.03,30.89 ; 19.07,30.84 19.03,30.89 ; v1(10.91,31.4) 10.91,32.42 11.93,33.43 v1(13.96,33.43) 15.1,33.43 15.86,32.67 16.74,32.67
PA0-CK_IN: length 13.8
  Top Layer w0.152: U1.6 10.33,22.57 10.02,22.26 10.02,21.75 7.35,19.08 7.35,13.49 6.34,12.48 6.34,11.33
PA5: length 5.9
  Top Layer w0.254: R4.2 13.25,19.39 13.83,19.97 U1.11
PB1: length 10.3
  Top Layer w0.152: U2.3 13.58,29.88 13.58,28.73 14.47,27.84 14.47,22.77 15.31,21.92 U1.14
PC14-OSC32_IN: length 6.5
  Top Layer w0.152: C2.2 7.19,27.38 7.32,27.25 X1.2 8.84,27.25 9.26,26.83 9.26,26.07 10.16,25.17 U1.2
PC15-OSC32_OUT: length 5.3
  Top Layer w0.152: 8.03,25.39 8.03,25.61 X1.1 ; 8.03,25.39 C1.1 ; 8.03,25.39 9.17,25.39 10.05,24.52 U1.3 ; 8.03,25.39 7.48,25.39
SWCLK: length 5.1
  Top Layer w0.152: U1.20 16.96,25.81 21.32,25.81 H3.2
SWDIO: length 7
  Top Layer w0.152: U1.19 20.06,25.17 22.13,23.11 H3.3
USART2_RX: length 4.9
  Top Layer w0.152: U1.9 10.16,20.62 9.77,20.22 v1(9.77,19.59)
  Bottom Layer w0.152: U3.2 10.78,19.08 10.28,19.59 v1(9.77,19.59)
USART2_TX: length 5.5
  Top Layer w0.152: U1.8 10.17,21.27 8.75,19.84 v1(8.75,19.59)
  Bottom Layer w0.152: v1(8.75,19.59) 8.24,19.08 U3.1

## Copper pours and planes (outline as drawn; the poured copper is in the pictures)
3.3V on Top Layer: 1.51,17.18 1.53,17.19 3.93,17.19 3.93,14.76 3.77,14.61 1.51,14.61
3.7V on Bottom Layer: 22.58,14.31 23.68,14.31 23.86,14.13 23.86,11.08 23.74,11.21 22.47,11.21 22.58,11.32
3.7V on Bottom Layer: 4.03,16.97 6.15,16.97 6.24,16.88 6.24,15.02 4.08,15.02 4.03,14.96
3.7V on Bottom Layer: 4.37,15.53 0.94,15.53 0.94,16.54 4.37,16.54
+5V on Bottom Layer: 2.15,21.88 5.7,21.88 5.7,18.95 5.58,18.83 3.94,18.83 3.3,18.19 2.15,18.19
A3.3V on Top Layer: 6.52,17.1 6.52,14.82 6.31,14.61 4.18,14.61 4.18,17.18 4.25,17.1
GND on Top Layer: -11.31,43.97 -10.55,44.74 48.88,44.74 50.92,42.7 50.92,-26 42.28,-17.37 -14.74,-17.37 -11.31,-13.94
GND on Bottom Layer: 0.88,40.42 36.95,40.42 38.47,38.89 38.47,5.49 32.5,-0.48 -1.66,-0.48 0.88,2.06
GND on Bottom Layer: 4.37,13.24 0.94,13.24 0.94,14.26 4.37,14.26
$Q1_1 on Top Layer: 10.23,18.35 12.71,18.35 12.71,17.03 12.41,15.53 10.4,15.53 10.23,15.7
PA0-CK_IN on Top Layer: 2.66,12.21 2.67,12.22 6.97,12.22 6.97,9.18 4.47,9.18 3.83,9.82 2.66,9.82

Small or netless copper shapes (teardrops, artwork), in the pictures only: 124 on Top Layer, 73 on Bottom Layer

## Text on the board
Bottom Silkscreen Layer: 3.7V GND
Top Silkscreen Layer: 5V触点 | LED状态灯 | GND触点 | 复位 | SWD SWC GND
